# EAGLE design EPGcontrolBipDAC (EAGLE 7.7.0)
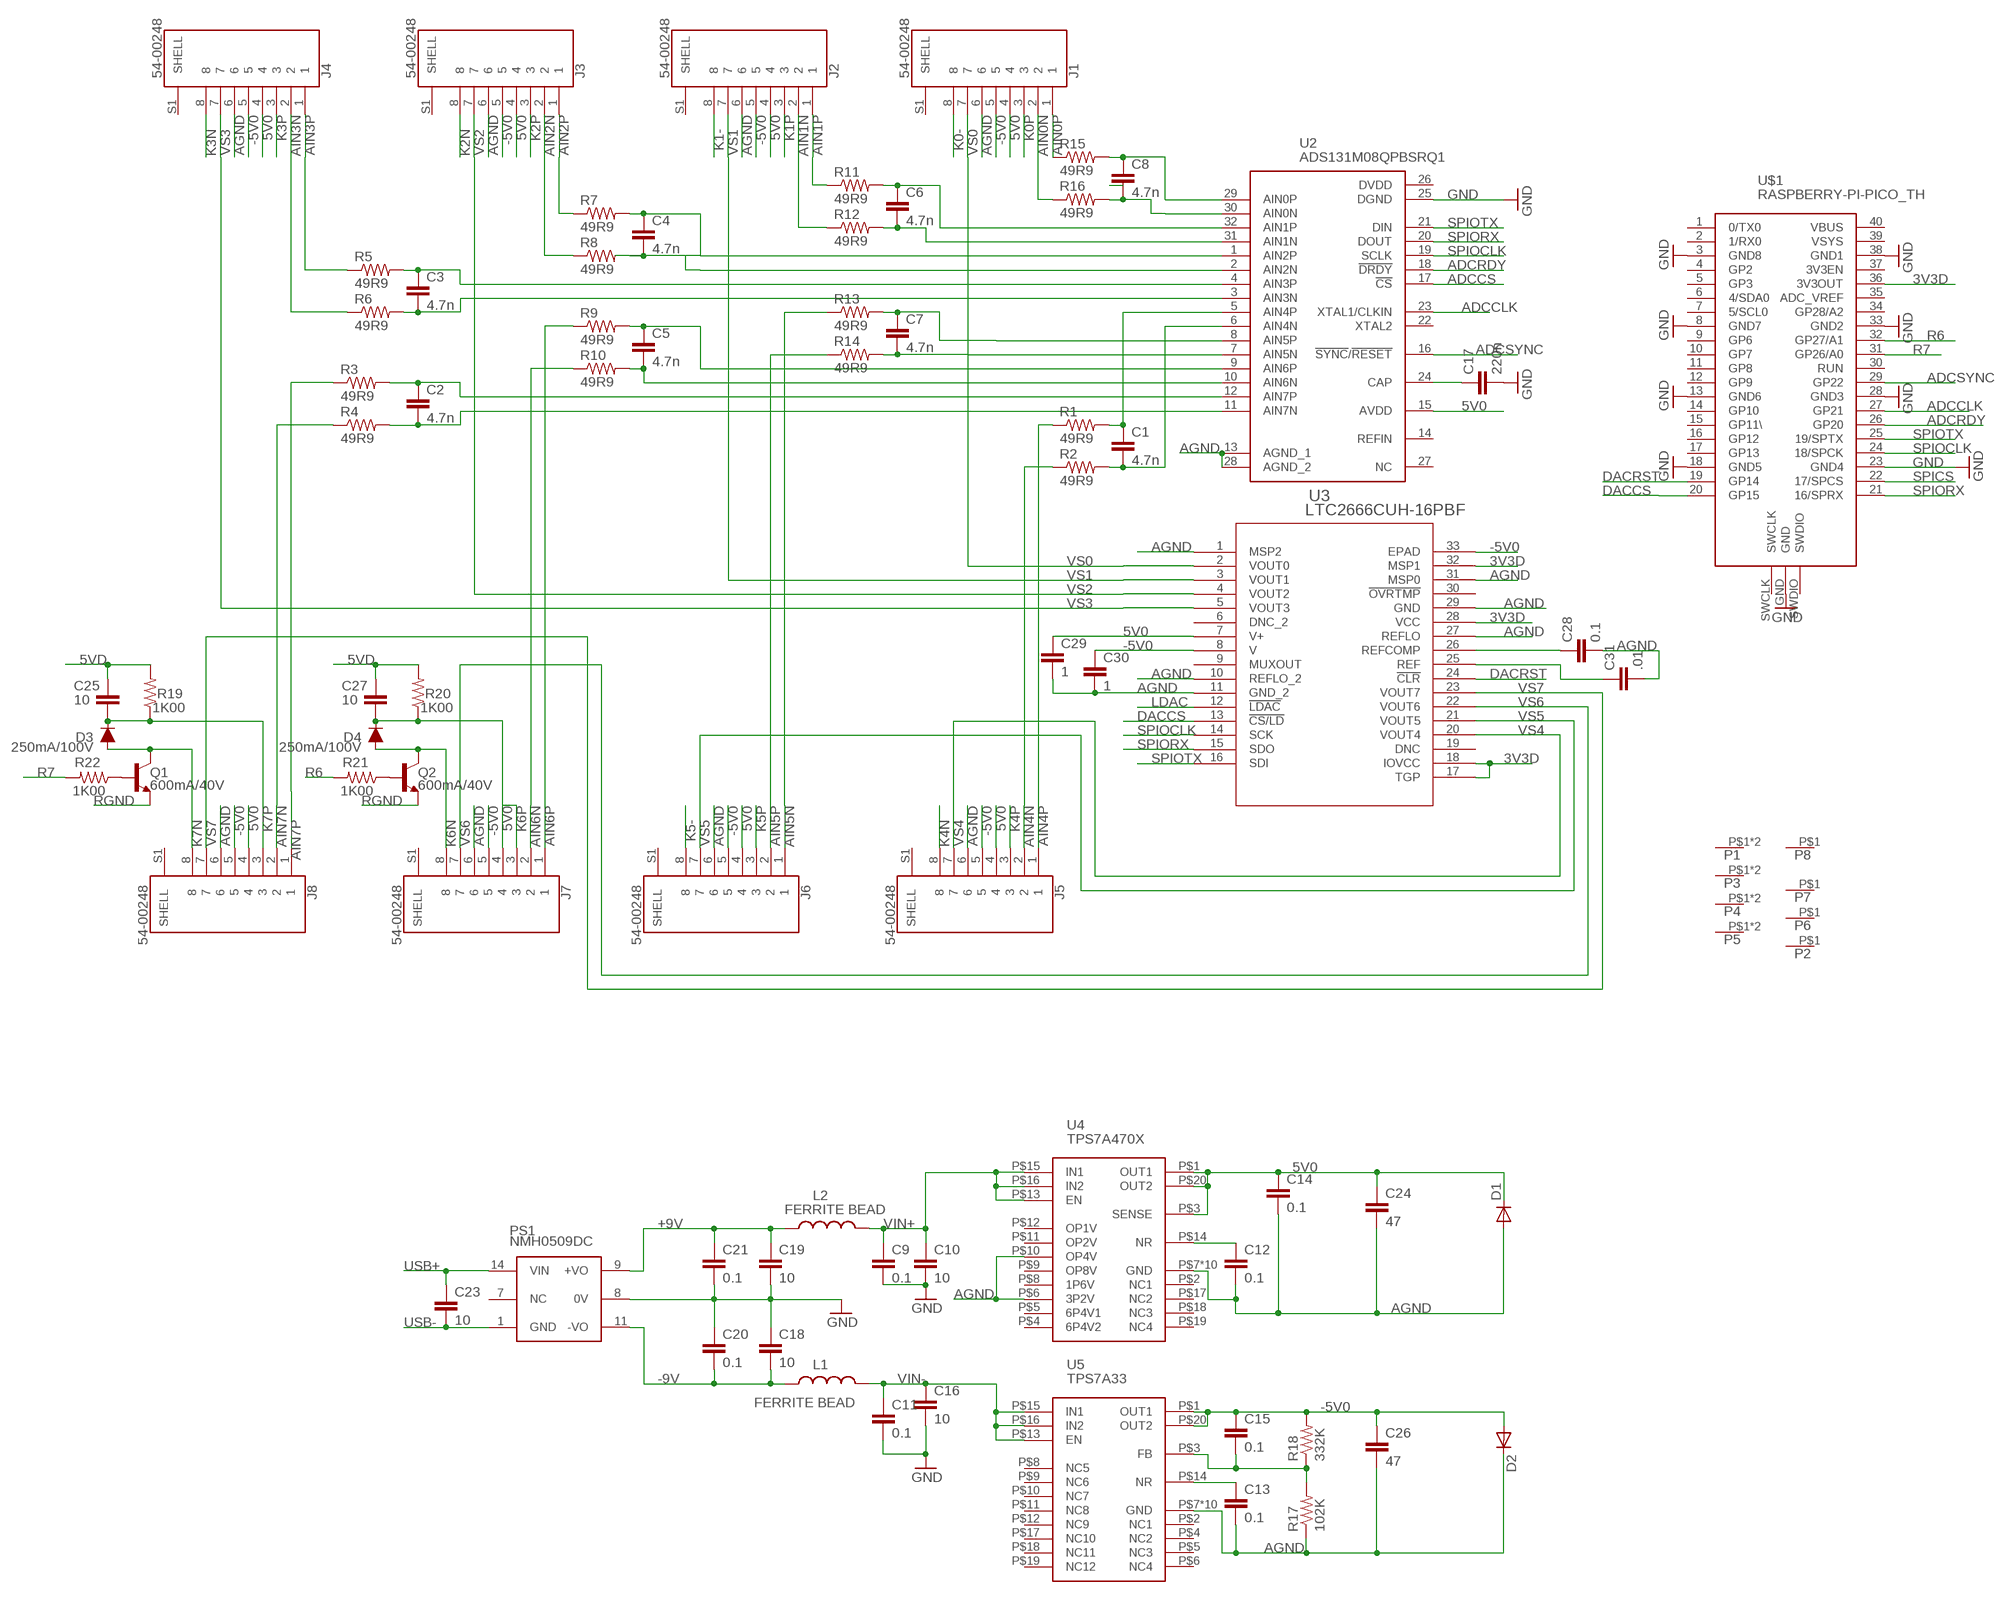
[diagram p0: schematic, sheet 1]

## Parts
C1  4.7n  CAPS0603S  [0603S]
C2  4.7n  CAPS0603S  [0603S]
C3  4.7n  CAPS0603S  [0603S]
C4  4.7n  CAPS0603S  [0603S]
C5  4.7n  CAPS0603S  [0603S]
C6  4.7n  CAPS0603S  [0603S]
C7  4.7n  CAPS0603S  [0603S]
C8  4.7n  CAPS0603S  [0603S]
C9  0.1  CAPS0603S  [0603S]
C10  10  C-EUC1206  [C1206]
C11  0.1  CAPS0603S  [0603S]
C12  0.1  CAPS0603S  [0603S]
C13  0.1  CAPS0603S  [0603S]
C14  0.1  CAPS0603S  [0603S]
C15  0.1  CAPS0603S  [0603S]
C16  10  C-EUC1206  [C1206]
C17  220n  CAPS0603S  [0603S]
C18  10  C-EUC1206  [C1206]
C19  10  C-EUC1206  [C1206]
C20  0.1  CAPS0603S  [0603S]
C21  0.1  CAPS0603S  [0603S]
C23  10  C-EUC1206  [C1206]
C24  47  C-EUC1206  [C1206]
C25  10  CAPS1206S  [1206S]
C26  47  C-EUC1206  [C1206]
C27  10  CAPS1206S  [1206S]
C28  0.1  CAPS0603S  [0603S]
C29  1  CAPS0805S  [0805S]
C30  1  CAPS0805S  [0805S]
C31  .01  CAPS0805S  [0805S]
D1  DIODESMA  [SMA-DIODE]
D2  DIODESMA  [SMA-DIODE]
D3  250mA/100V  DIODE-BAS16J  [SOD-323]
D4  250mA/100V  DIODE-BAS16J  [SOD-323]
J1  54-00248  [TENSILITY_54-00248]
J2  54-00248  [TENSILITY_54-00248]
J3  54-00248  [TENSILITY_54-00248]
J4  54-00248  [TENSILITY_54-00248]
J5  54-00248  [TENSILITY_54-00248]
J6  54-00248  [TENSILITY_54-00248]
J7  54-00248  [TENSILITY_54-00248]
J8  54-00248  [TENSILITY_54-00248]
L1  FERRITE BEAD  INDUCTOR_SM0805S  [0805S]
L2  FERRITE BEAD  INDUCTOR_SM0805S  [0805S]
P1  CON1BANANA  [BANANA_105-0754-001]
P2  CON1574  [574]
P3  CON1BANANA  [BANANA_105-0754-001]
P4  CON1BANANA  [BANANA_105-0754-001]
P5  CON1BANANA  [BANANA_105-0754-001]
P6  CON1574  [574]
P7  CON1574  [574]
P8  CON1574  [574]
PS1  NMH0509DC  DC-DC-PDS1-DUALPDM2  [PDM2]
Q1  600mA/40V  TRANS_NPN-MMBT2222AL  [SOT23-3]
Q2  600mA/40V  TRANS_NPN-MMBT2222AL  [SOT23-3]
R1  49R9  RESISTOR_SM0805S  [0805S]
R2  49R9  RESISTOR_SM0805S  [0805S]
R3  49R9  RESISTOR_SM0805S  [0805S]
R4  49R9  RESISTOR_SM0805S  [0805S]
R5  49R9  RESISTOR_SM0805S  [0805S]
R6  49R9  RESISTOR_SM0805S  [0805S]
R7  49R9  RESISTOR_SM0805S  [0805S]
R8  49R9  RESISTOR_SM0805S  [0805S]
R9  49R9  RESISTOR_SM0805S  [0805S]
R10  49R9  RESISTOR_SM0805S  [0805S]
R11  49R9  RESISTOR_SM0805S  [0805S]
R12  49R9  RESISTOR_SM0805S  [0805S]
R13  49R9  RESISTOR_SM0805S  [0805S]
R14  49R9  RESISTOR_SM0805S  [0805S]
R15  49R9  RESISTOR_SM0805S  [0805S]
R16  49R9  RESISTOR_SM0805S  [0805S]
R17  102K  R-US_R0805  [R0805]
R18  332K  R-US_R0805  [R0805]
R19  1K00  RESISTOR_SM0805S  [0805S]
R20  1K00  RESISTOR_SM0805S  [0805S]
R21  1K00  RESISTOR_SM0805S  [0805S]
R22  1K00  RESISTOR_SM0805S  [0805S]
U2  ADS131M08QPBSRQ1  [QFP50P700X700X120-32N]
U3  LTC2666CUH-16PBF  [UH_32_ADI]
U4  TPS7A470X  [VQFN-20-5X5]
U5  TPS7A33  [VQFN-20-5X5]
U$1  RASPBERRY-PI-PICO_TH  [FT_RASPBERRY-PI-PICO_TH]

## Nets
3V3D: U3.17(TGP) U3.18(IOVCC) U3.28(VCC) U3.32(MSP1) U$1.36(3V3OUT)
5V0: C14.1 C24.1 C29.1 D1.C J1.4 J2.4 J3.4 J4.4 J5.4 J6.4 J7.4 J8.4 U2.15(AVDD) U3.7(V+) U4.P$1(OUT1) U4.P$3(SENSE) U4.P$20(OUT2)
5VD: C25.1 C27.1 R19.2 R20.2
+9V: C19.1 C21.1 L2.1 PS1.9(+VO)
-5V0: C15.1 C26.1 C30.1 D2.A J1.5 J2.5 J3.5 J4.5 J5.5 J6.5 J7.5 J8.5 R18.2 U3.8(V) U3.33(EPAD) U5.P$1(OUT1) U5.P$20(OUT2)
-9V: C18.2 C20.2 L1.1 PS1.11(-VO)
A0N: C8.2 R16.2 U2.30(AIN0N)
A0P: C8.1 R15.2 U2.29(AIN0P)
A1N: C6.2 R12.2 U2.31(AIN1N)
A1P: C6.1 R11.2 U2.32(AIN1P)
A2N: C4.2 R8.2 U2.2(AIN2N)
A2P: C4.1 R7.2 U2.1(AIN2P)
A3N: C3.2 R6.2 U2.3(AIN3N)
A3P: C3.1 R5.2 U2.4(AIN3P)
A4N: C1.2 R2.2 U2.6(AIN4N)
A4P: C1.1 R1.2 U2.5(AIN4P)
A5N: C7.2 R14.2 U2.7(AIN5N)
A5P: C7.1 R13.2 U2.8(AIN5P)
A6N: C5.2 R10.2 U2.10(AIN6N)
A6P: C5.1 R9.2 U2.9(AIN6P)
A7N: C2.2 R4.2 U2.11(AIN7N)
A7P: C2.1 R3.2 U2.12(AIN7P)
ADCCLK: U2.23(XTAL1/CLKIN) U$1.27(GP21)
ADCCS: U2.17(!CS)
ADCRDY: U2.18(!DRDY) U$1.26(GP20)
ADCSYNC: U2.16(!SYNC!/!RESET) U$1.29(GP22)
AGND: C12.2 C13.2 C14.2 C24.2 C26.2 C28.2 C29.2 C30.2 C31.2 D1.A D2.C J1.6 J2.6 J3.6 J4.6 J5.6 J6.6 J7.6 J8.6 R17.1 U2.13(AGND_1) U2.28(AGND_2) U3.1(MSP2) U3.10(REFLO_2) U3.11(GND_2) U3.27(REFLO) U3.29(GND) U3.31(MSP0) U4.P$6(3P2V) U4.P$7(GND) U4.P$10(OP4V) U4.PAD1(GND) U4.PAD2(GND) U4.PAD3(GND) U4.PAD4(GND) U4.PAD5(GND) U4.PAD6(GND) U4.PAD7(GND) U4.PAD8(GND) U4.PAD9(GND) U5.P$7(GND) U5.PAD1(GND) U5.PAD2(GND) U5.PAD3(GND) U5.PAD4(GND) U5.PAD5(GND) U5.PAD6(GND) U5.PAD7(GND) U5.PAD8(GND) U5.PAD9(GND)
AIN0N: J1.2 R16.1
AIN0P: J1.1 R15.1
AIN1N: J2.2 R12.1
AIN1P: J2.1 R11.1
AIN2N: J3.2 R8.1
AIN2P: J3.1 R7.1
AIN3N: J4.2 R6.1
AIN3P: J4.1 R5.1
AIN4N: J5.2 R2.1
AIN4P: J5.1 R1.1
AIN5N: J6.1 R13.1
AIN5P: J6.2 R14.1
AIN6N: J7.2 R10.1
AIN6P: J7.1 R9.1
AIN7N: J8.2 R4.1
AIN7P: J8.1 R3.1
DACCS: U3.13(!CS/LD) U$1.20(GP15)
DACRST: U3.24(!CLR) U$1.19(GP14)
GND: C9.2 C10.2 C11.2 C16.2 C17.2 C18.1 C19.2 C20.1 C21.2 PS1.8(0V) U2.25(DGND) U$1.3(GND8) U$1.8(GND7) U$1.13(GND6) U$1.18(GND5) U$1.23(GND4) U$1.28(GND3) U$1.33(GND2) U$1.38(GND1) U$1.GND
K0-: J1.8
K0P: J1.3
K1-: J2.8
K1P: J2.3
K2N: J3.8
K2P: J3.3
K3N: J4.8
K3P: J4.3
K4N: J5.8
K4P: J5.3
K5-: J6.8
K5P: J6.3
K6N: D4.A J7.8 Q2.3(C)
K6P: C27.2 D4.C J7.3 R20.1
K7N: D3.A J8.8 Q1.3(C)
K7P: C25.2 D3.C J8.3 R19.1
LDAC: U3.12(!LDAC)
N$1: C15.2 R17.2 R18.1 U5.P$3(FB)
N$2: C17.1 U2.24(CAP)
N$3: Q2.1(B) R21.1
N$4: Q1.1(B) R22.1
N$8: C28.1 U3.26(REFCOMP)
N$11: C31.1 U3.25(REF)
N$18: C13.1 U5.P$14(NR)
N$23: C12.1 U4.P$14(NR)
R6: R21.2 U$1.32(GP27/A1)
R7: R22.2 U$1.31(GP26/A0)
RGND: Q1.2(E) Q2.2(E)
SPICS: U$1.22(17/SPCS)
SPIOCLK: U2.19(SCLK) U3.14(SCK) U$1.24(18/SPCK)
SPIORX: U2.20(DOUT) U3.15(SDO) U$1.21(16/SPRX)
SPIOTX: U2.21(DIN) U3.16(SDI) U$1.25(19/SPTX)
USB+: C23.1 PS1.14(VIN)
USB-: C23.2 PS1.1(GND)
VIN+: C9.1 C10.1 L2.2 U4.P$13(EN) U4.P$15(IN1) U4.P$16(IN2)
VIN-: C11.1 C16.1 L1.2 U5.P$13(EN) U5.P$15(IN1) U5.P$16(IN2)
VS0: J1.7 U3.2(VOUT0)
VS1: J2.7 U3.3(VOUT1)
VS2: J3.7 U3.4(VOUT2)
VS3: J4.7 U3.5(VOUT3)
VS4: J5.7 U3.20(VOUT4)
VS5: J6.7 U3.21(VOUT5)
VS6: J7.7 U3.22(VOUT6)
VS7: J8.7 U3.23(VOUT7)
Unconnected: J1.S1(SHELL) J2.S1(SHELL) J3.S1(SHELL) J4.S1(SHELL) J5.S1(SHELL) J6.S1(SHELL) J7.S1(SHELL) J8.S1(SHELL) P1.P$1 P1.P$2 P2.P$1 P3.P$1 P3.P$2 P4.P$1 P4.P$2 P5.P$1 P5.P$2 P6.P$1 P7.P$1 P8.P$1 PS1.7(NC) U2.14(REFIN) U2.22(XTAL2) U2.26(DVDD) U2.27(NC) U3.6(DNC_2) U3.9(MUXOUT) U3.19(DNC) U3.30(!OVRTMP) U4.P$2(NC1) U4.P$4(6P4V2) U4.P$5(6P4V1) U4.P$8(1P6V) U4.P$9(OP8V) U4.P$11(OP2V) U4.P$12(OP1V) U4.P$17(NC2) U4.P$18(NC3) U4.P$19(NC4) U5.P$2(NC1) U5.P$4(NC2) U5.P$5(NC3) U5.P$6(NC4) U5.P$8(NC5) U5.P$9(NC6) U5.P$10(NC7) U5.P$11(NC8) U5.P$12(NC9) U5.P$17(NC10) U5.P$18(NC11) U5.P$19(NC12) U$1.1(0/TX0) U$1.2(1/RX0) U$1.4(GP2) U$1.5(GP3) U$1.6(4/SDA0) U$1.7(5/SCL0) U$1.9(GP6) U$1.10(GP7) U$1.11(GP8) U$1.12(GP9) U$1.14(GP10) U$1.15(GP11\) U$1.16(GP12) U$1.17(GP13) U$1.30(RUN) U$1.34(GP28/A2) U$1.35(ADC_VREF) U$1.37(3V3EN) U$1.39(VSYS) U$1.40(VBUS) U$1.SWCLK U$1.SWDIO

## Library data of the parts
C1-C9 C11-C15 C17 C20 C21 C25 C27-C31 = STEVES_BU:CAPS
C10 C16 C18 C19 C23 C24 C26 = rcl:C-EU: CAPACITOR, European symbol
D1 D2 = SparkFun:DIODE: Diode
D3 D4 = SparkFun-DiscreteSemi:DIODE: Diode; PROD_ID: DIO-09646
J1-J8 = 54-00248:54-00248
L1 L2 = STEVES_BU:INDUCTOR_SM
P1-P8 = STEVES_BU:CON1
PS1 = STEVES_BU:DC-DC-PDS1-DUAL
Q1 Q2 = SparkFun-DiscreteSemi:TRANS_NPN: NPN transistor Current controlled devices typically used to amplify current or used as a switch. BC547 - COM-08928 <http://www.sparkfun.com/products/8928> (TO-92 45V 100mA) (1.Collector 2.Base 3.Emitter) 2N3904 - COM-00521 <http://www.sparkfun.com/products/521> (TO-92 40V 200mA) (1.Emitter 2.Base 3.Collector) P2N2222A - COM-12852 <http://www.sparkfun.com/products/12852> (TO-92 40V 600mA) (1.Collector 2.Base 3.Emitter); PROD_ID: TRANS-08049
R1-R16 R19-R22 = STEVES_BU:RESISTOR_SM
R17 R18 = rcl:R-US_: RESISTOR, American symbol
U2 = SamacSys_Parts:ADS131M08QPBSRQ1: Analog to Digital Converters - ADC Automotive, eight-channel, 24-bit, 32-kSPS, simultaneous-sampling, delta-sigma ADC Source: Datasheet <https://www.ti.com/lit/ds/symlink/ads131m08-q1.pdf?HQS=dis-mous-null-mousermode-dsf-pf-null-wwe&ts=1673864581738&ref_url=https%3A%2F%2Fwww.ti.com%2Fgeneral%2Fdocs%2Fsuppproductinfo.tsp%3FdistId%3D26%26gotoUrl%3Dhttps%3A%2F%2Fwww.>; ARROW_PART_NUMBER: ADS131M08QPBSRQ1; ARROW_PRICE-STOCK: https://www.arrow.com/en/products/ads131m08qpbsrq1/texas-instruments.html?utm_currency=USD&region=nac; DESCRIPTION: Analog to Digital Converters - ADC Automotive, eight-channel, 24-bit, 32-kSPS, simultaneous-sampling, delta-sigma ADC; HEIGHT: 1.2mm; MANUFACTURER_NAME: Texas Instruments; MANUFACTURER_PART_NUMBER: ADS131M08QPBSRQ1; MOUSER_PART_NUMBER: 595-ADS131M08QPBSRQ1; MOUSER_PRICE-STOCK: https://www.mouser.co.uk/ProductDetail/Texas-Instruments/ADS131M08QPBSRQ1?qs=By6Nw2ByBD1kYCTLuI53zA%3D%3D
U3 = STEVES_BU:LTC2666CUH-16PBF; COPYRIGHT: Copyright (C) 2026 Ultra Librarian. All rights reserved.; DATASHEET: https://www.analog.com/media/en/technical-documentation/data-sheets/ltc2666.pdf; DESCRIPTION: Octal 16-Bit/12-Bit ±10V VOUT SoftSpan DACs with 10ppm/°C Max Reference; MANUFACTURER_NAME: Analog Devices Inc; MANUFACTURER_PART_NUMBER: LTC2666CUH-16#PBF
U4 = STEVES_BU:TPS7A470X
U5 = STEVES_BU:TPS7A33: TPS7A33 –36-V, 1-A, Ultralow-Noise Negative Voltage Regulator
U$1 = pipico:RASPBERRY-PI-PICO_TH: Raspberry Pi Pico microcontroller board for through-hole mounting.

## Board
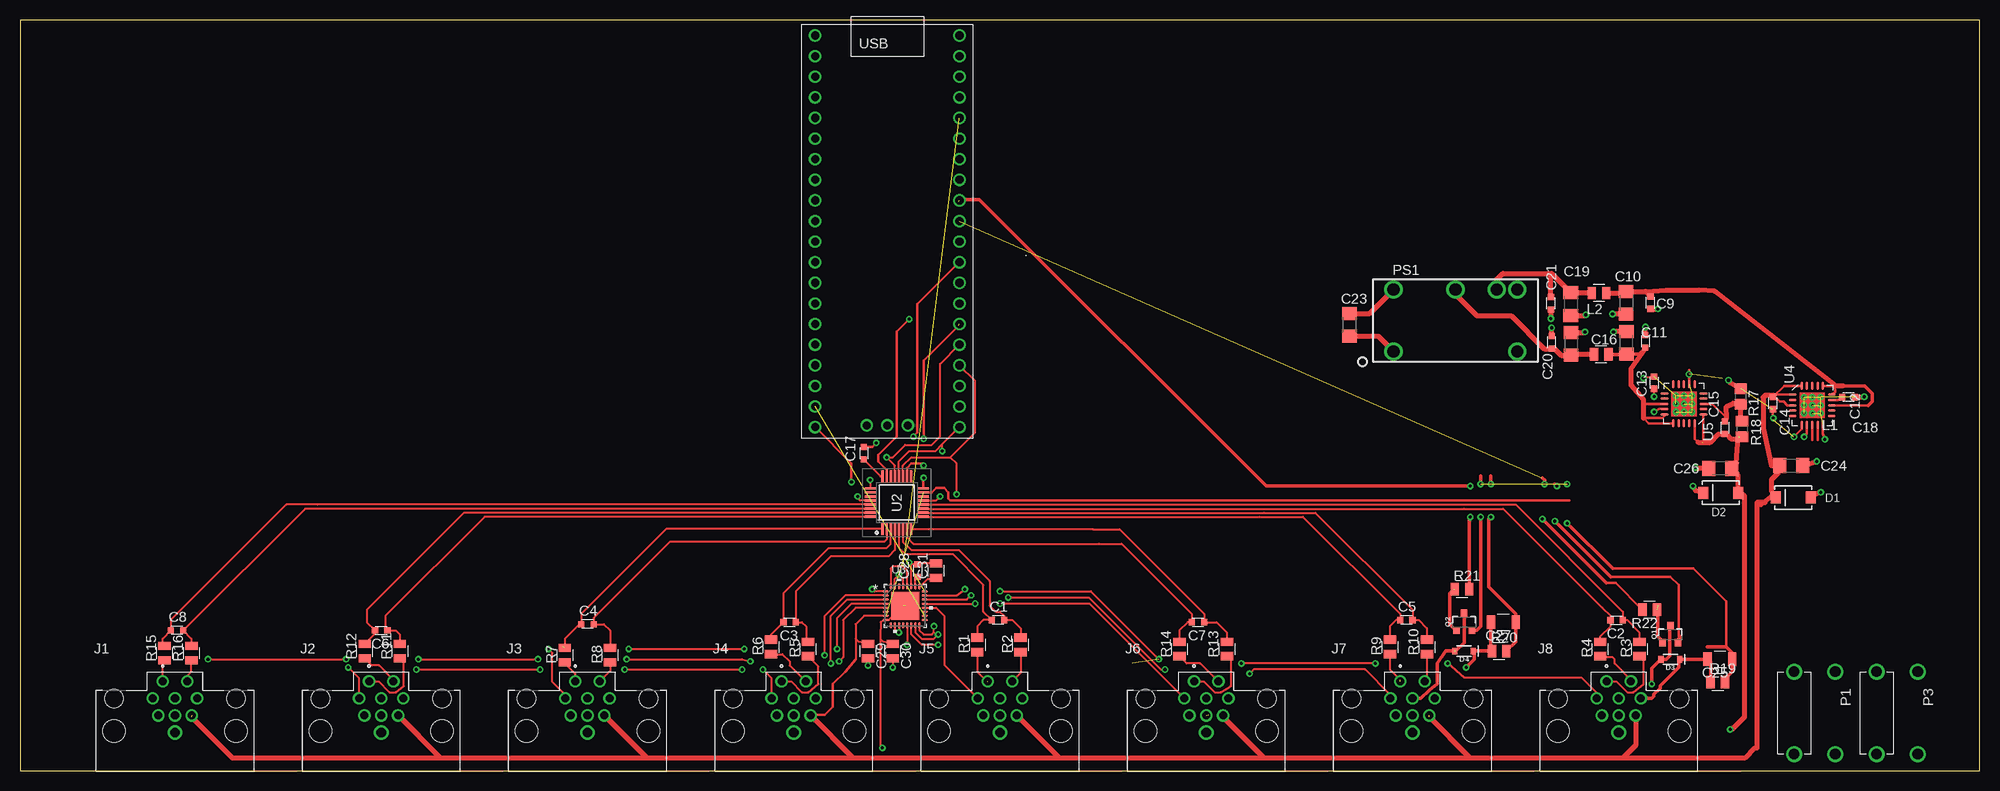
[diagram p1: board, top side]
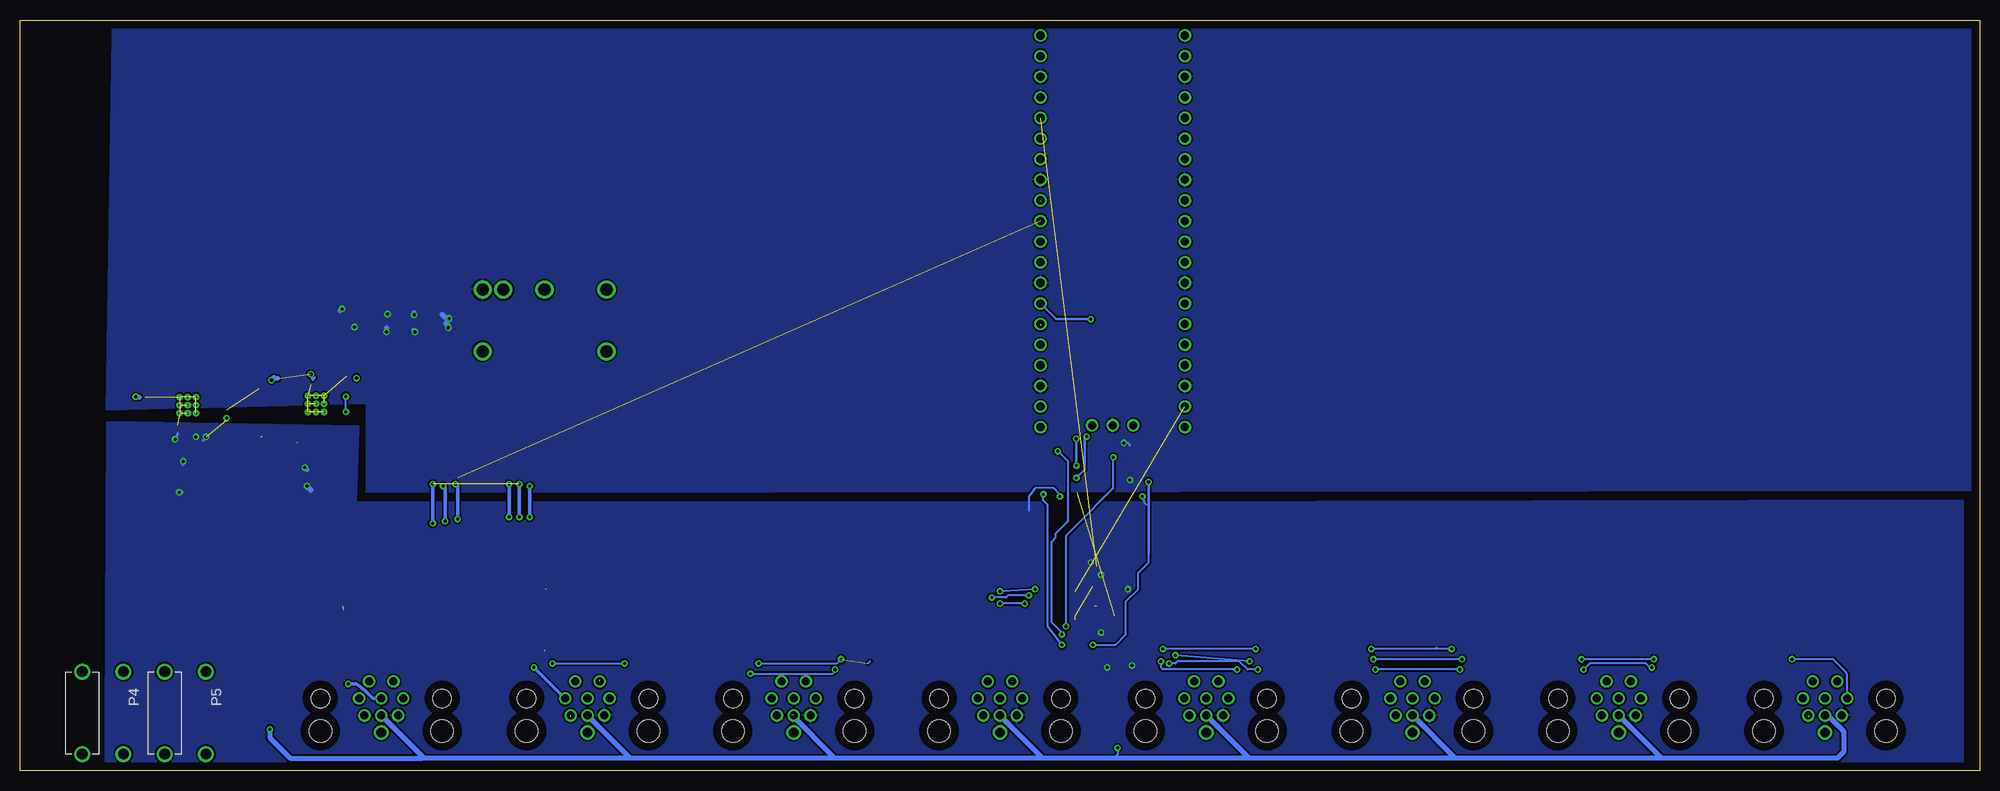
[diagram p2: board, bottom side, seen from below]

Size 241.3 x 92.46 mm. Coordinates in mm from the lower left corner, seen from the top.
Outline: 0,0 241.3,0 241.3,92.46 0,92.46 0,0
Copper layers (1*16): Top 0.035mm / dielectric 1.5mm / Bottom 0.035mm
Design rules "default": minimum track width 10mil, minimum drill 24mil, track to track 8mil, track to pad 8mil, pad to pad 8mil, via to via 8mil, smd to smd 8mil, copper to edge 40mil, drill to drill 8mil, minimum pad ring 10mil, minimum via ring 8mil, stop-mask expansion 4mil, vias tented up to drill 0mil, thermal gap 10mil

### Footprints (pad centres in the part's own frame; a part is rotated, then mirrored left to right if it is on the bottom)
0603S = smd 0.762 x 0.762: 1 -0.762,0; 2 0.762,0
C1206 = smd 1.6 x 1.8: 1 -1.4,0; 2 1.4,0
1206S = smd 1.016 x 1.651: 1 -1.524,0; 2 1.524,0
0805S = smd 1.016 x 1.524: 1 -0.889,0; 2 0.889,0
SMA-DIODE = smd 1.27 x 1.47: A -2.15,0; C 2.15,0
SOD-323 = smd 0.63 x 0.83: A 1.15,0; C -1.15,0
TENSILITY_54-00248 = drill 1 pad 1.4: 1 -1.5,2.1; 2 1.5,2.1; 3 2.725,0; 4 2.075,-2.1; 5 0,-2.1; 6 -2.075,-2.1; 7 -2.725,0; 8 0,0 | drill 1.2 pad 1.7: S1 0,-4.191 | hole 2.3: -7.5,0; 7.5,0 | hole 2.8: -7.5,-4; 7.5,-4
BANANA_105-0754-001 = drill 1.321: P$1 0,0; P$2 -10.16,0
574 = drill 5.41: P$1 0,0
PDM2 = drill 1.5: 1 -7.62,-3.81; 7 7.62,-3.81; 8 7.62,3.81; 9 5.08,3.81; 11 0,3.81; 14 -7.62,3.81
SOT23-3 = smd 0.8 x 0.9: 1 -0.95,-1; 2 0.95,-1; 3 0,1.1
R0805 = smd 1.3 x 1.5: 1 -0.95,0; 2 0.95,0
QFP50P700X700X120-32N = smd 1.45 x 0.3: 1 -3.225,1.75; 2 -3.225,1.25; 3 -3.225,0.75; 4 -3.225,0.25; 5 -3.225,-0.25; 6 -3.225,-0.75; 7 -3.225,-1.25; 8 -3.225,-1.75; 17 3.225,-1.75; 18 3.225,-1.25; 19 3.225,-0.75; 20 3.225,-0.25; 21 3.225,0.25; 22 3.225,0.75; 23 3.225,1.25; 24 3.225,1.75 | smd 0.3 x 1.45: 9 -1.75,-3.225; 10 -1.25,-3.225; 11 -0.75,-3.225; 12 -0.25,-3.225; 13 0.25,-3.225; 14 0.75,-3.225; 15 1.25,-3.225; 16 1.75,-3.225; 25 1.75,3.225; 26 1.25,3.225; 27 0.75,3.225; 28 0.25,3.225; 29 -0.25,3.225; 30 -0.75,3.225; 31 -1.25,3.225; 32 -1.75,3.225
UH_32_ADI = smd 0.813 x 0.254: 1 -2.4,1.75; 2 -2.4,1.25; 3 -2.4,0.75; 4 -2.4,0.25; 5 -2.4,-0.25; 6 -2.4,-0.75; 7 -2.4,-1.25; 8 -2.4,-1.75; 17 2.4,-1.75; 18 2.4,-1.25; 19 2.4,-0.75; 20 2.4,-0.25; 21 2.4,0.25; 22 2.4,0.75; 23 2.4,1.25; 24 2.4,1.75 | smd 0.254 x 0.813: 9 -1.75,-2.4; 10 -1.25,-2.4; 11 -0.75,-2.4; 12 -0.25,-2.4; 13 0.25,-2.4; 14 0.75,-2.4; 15 1.25,-2.4; 16 1.75,-2.4; 25 1.75,2.4; 26 1.25,2.4; 27 0.75,2.4; 28 0.25,2.4; 29 -0.25,2.4; 30 -0.75,2.4; 31 -1.25,2.4; 32 -1.75,2.4 | smd 3.454 x 3.454: 33 0,0
VQFN-20-5X5 = smd 0.95 x 0.3: P$1 -2.4,1.3; P$2 -2.4,0.65; P$3 -2.4,0; P$4 -2.4,-0.65; P$5 -2.4,-1.3; P$11 2.4,-1.3; P$12 2.4,-0.65; P$13 2.4,0; P$14 2.4,0.65; P$15 2.4,1.3 | smd 0.3 x 0.95: P$6 -1.3,-2.4; P$7 -0.65,-2.4; P$8 0,-2.4; P$9 0.65,-2.4; P$10 1.3,-2.4; P$16 1.3,2.4; P$17 0.65,2.4; P$18 0,2.4; P$19 -0.65,2.4; P$20 -1.3,2.4 | drill 0.305: PAD1 -1,1; PAD2 0,1; PAD3 1,1; PAD4 -1,0; PAD5 0,0; PAD6 1,0; PAD7 -1,-1; PAD8 0,-1; PAD9 1,-1
FT_RASPBERRY-PI-PICO_TH = drill 1: 1 -8.55,24.03; 2 -8.55,21.49; 3 -8.55,18.95; 4 -8.55,16.41; 5 -8.55,13.87; 6 -8.55,11.33; 7 -8.55,8.79; 8 -8.55,6.25; 9 -8.55,3.71; 10 -8.55,1.17; 11 -8.55,-1.37; 12 -8.55,-3.91; 13 -8.55,-6.45; 14 -8.55,-8.99; 15 -8.55,-11.53; 16 -8.55,-14.07; 17 -8.55,-16.61; 18 -8.55,-19.15; 19 -8.55,-21.69; 20 -8.55,-24.23; 21 9.23,-24.23; 22 9.23,-21.69; 23 9.23,-19.15; 24 9.23,-16.61; 25 9.23,-14.07; 26 9.23,-11.53; 27 9.23,-8.99; 28 9.23,-6.45; 29 9.23,-3.91; 30 9.23,-1.37; 31 9.23,1.17; 32 9.23,3.71; 33 9.23,6.25; 34 9.23,8.79; 35 9.23,11.33; 36 9.23,13.87; 37 9.23,16.41; 38 9.23,18.95; 39 9.23,21.49; 40 9.23,24.03; GND 0.34,-24; SWCLK -2.2,-24; SWDIO 2.88,-24

### Placement (x,y rotation side)
C1  120.4,18.54 0 top
C2  196.6,18.54 180 top
C3  94.74,18.29 180 top
C4  69.85,18.03 0 top
C5  170.69,18.54 0 top
C6  44.45,17.27 180 top
C7  145.03,18.29 180 top
C8  19.3,17.27 0 top
C9  200.76,57.66 270 top
C10  197.76,57.63 270 top
C11  200.12,52.89 90 top
C12  225.15,46 0 top
C13  201.19,47.81 90 top
C14  215.84,45.28 270 top
C15  209.91,42.26 90 top
C16  197.8,52.7 90 top
C17  103.89,39.12 90 top
C18  190.97,52.6 270 top
C19  190.94,57.5 270 top
C20  188.59,52.78 270 top
C21  188.5,57.58 270 top
C23  163.67,54.92 270 top
C24  218.1,37.6 0 top
C25  209.3,13.72 180 top
C26  209.35,37.23 180 top
C27  182.63,18.29 180 top
C28  110.49,24.64 90 top
C29  104.39,14.73 270 top
C30  107.44,14.73 270 top
C31  112.78,24.64 90 top
D1  218.34,33.63 180 top
D2  209.4,34.23 180 top
D3  203.2,13.72 180 top
D4  177.8,14.73 180 top
J1  19.05,8.89 0 top
J2  44.45,8.89 0 top
J3  69.85,8.89 0 top
J4  95.25,8.89 0 top
J5  120.65,8.89 0 top
J6  146.05,8.89 0 top
J7  171.45,8.89 0 top
J8  196.85,8.89 0 top
L1  194.69,51.3 0 top
L2  194.41,58.85 0 top
P1  218.44,2.03 270 top
P2  218.69,-22.86 0 top  (outside the outline)
P3  228.6,2.03 270 top
P4  233.68,2.03 270 bottom
P5  223.52,2.03 270 bottom
P6  234.19,-22.86 0 top  (outside the outline)
P7  218.69,-39.88 0 top  (outside the outline)
P8  234.7,-40.89 0 top  (outside the outline)
PS1  176.74,55.46 0 top
Q1  203.2,16.76 0 top
Q2  177.8,18.29 0 top
R1  117.86,15.49 90 top
R2  123.19,15.49 90 top
R3  199.39,14.99 90 top
R4  194.56,14.99 90 top
R5  97.03,14.99 90 top
R6  92.46,15.24 90 top
R7  67.06,14.22 90 top
R8  72.64,14.22 90 top
R9  168.66,15.24 90 top
R10  173.23,15.24 90 top
R11  46.74,14.73 90 top
R12  42.42,14.73 90 top
R13  148.59,14.99 90 top
R14  142.75,14.99 90 top
R15  17.78,14.48 90 top
R16  21.08,14.48 90 top
R17  211.86,46.1 270 top
R18  212.02,42.1 270 top
R19  209.04,10.92 0 top
R20  182.12,14.73 0 top
R21  177.55,22.35 0 top
R22  200.66,19.81 180 top
U2  107.95,33.02 90 top
U3  108.97,20.32 0 top
U4  220.68,45.02 0 top
U5  204.88,45.19 180 top
U$1  106.43,66.55 0 top

### Tracks (layer width: path | path; a pad name or v marks a point on that pad's centre or on a via)
3V3D  (3 unrouted)
  Top 0.254: U3.28 109.22,24.64 108.71,25.15 107.44,25.15 107.19,24.89 107.19,22.75 U3.32
5V0  (3 unrouted)
  Top 0.254: U3.7 103.91,19.07 102.87,18.03 102.87,16.26 | 102.87,16.26 102.87,13.72 | C29.1 103.25,15.88 102.87,16.26
  Top 0.305: U4.P$1 216.12,46.32 C14.1 | U4.P$20 217.22,47.42 C14.1 | U4.P$3 217.62,45.02 217.17,45.47 216.66,45.47 215.9,46.23 215.9,46.1 C14.1 | U2.15 112.25,34.27 112.78,34.8 113.79,34.8 114.3,34.29 114.3,33.53 114.55,33.27 190.75,33.27 | 214.88,33.02 215.65,33.78 | 102.87,13.72 101.6,12.19 100.08,10.67 100.08,7.87 99.06,6.86 97.39,6.86 J4.4
  Top 0.61: J8.4 198.93,3.09 197.36,1.52 | 197.36,1.52 178.56,1.52 | 178.56,1.52 173.48,6.6 | 178.56,1.52 153.16,1.52 | 153.16,1.52 148.08,6.6 148.08,6.75 J6.4 | 153.16,1.52 127.99,1.52 | 127.99,1.52 J5.4 | 127.99,1.52 102.59,1.52 | 102.59,1.52 J4.4 | 102.59,1.52 77.19,1.52 | 77.19,1.52 J3.4 | 77.19,1.52 51.79,1.52 | 51.79,1.52 J2.4 | 51.79,1.52 26.16,1.52 21.08,6.6 | 216.11,33.75 215.65,34.44 215.65,35.81 216.44,36.61 C24.1 216.69,37.59 215.65,37.59 214.63,42.16 214.63,45.97 214.88,46.23 215.9,46.23 | 216.11,33.75 D1.C | 214.38,32.77 215.65,33.78 216.15,33.71 216.11,33.75 | 214.88,33.02 213.87,33.02 213.87,2.79 213.61,2.79 212.34,1.52 197.36,1.52
5VD  (via drill 0.38)  (1 unrouted)
  Top 0.305: 196.09,24.89 205.99,24.89 210.06,20.83 210.06,15.24 210.19,15.11
  Top 0.406: R20.2 184.15,15.88 C27.1 184.15,19.3 180.85,22.61 180.85,30.99 v181.1,31.24 | v181.1,35.31 181.1,36.32 | R19.2 209.93,11.3 210.82,12.19 C25.1 210.82,14.48 210.19,15.11 210.06,15.24 207.77,15.24 | 196.09,24.89 v190.5,30.48 | v190.5,35.31 190.5,35.05
  Bottom 0.406: v181.1,31.24 v181.1,35.31 | v190.5,30.48 v190.5,35.31
+9V
  Top 0.61: PS1.9 181.82,60.48 182.59,61.25 188.19,61.25 | 188.19,61.25 188.58,61.25 C19.1 190.98,58.85 L2.1 | C21.1 188.5,60.95 188.19,61.25
-5V0  (via drill 0.38)  (5 unrouted)
  Top 0.254: 105.92,16.26 105.92,16.51 105.95,18.32 U3.8 106.96,18.57 107.7,19.3 108.71,20.32 | 105.92,16.26 105.92,10.67 105.92,10.41 105.92,3.05 v106.17,2.79 | C30.1 106.3,15.88 105.92,16.26
  Top 0.28: U5.P$1 207.28,40.37 | U5.P$20 206.18,41.17 | 211.66,41.06 R18.2
  Top 0.305: 210.59,5.1 v210.57,5.08 | 206.18,41.17 206.18,40.88 206.61,40.45
  Top 0.61: 206.61,40.45 207.14,40.42 | R18.2 211.76,40.89 210.66,40.89 210.06,41.5 C15.1 209.8,41.4 209.04,41.4 208.03,40.39 207.26,40.39 | 211.58,34.21 D2.A | D2.A 211.55,36.43 C26.1 210.75,37.27 211.33,37.85 211.58,41.15 | 210.59,5.1 210.84,5.1 212.34,6.6 212.34,33.78 211.84,34.29 211.61,34.29 D2.A
  Bottom 0.254: v106.17,2.79 106.17,2.03 106.43,1.78 106.43,1.52
  Bottom 0.61: J1.5 18.73,6.79 16.76,4.83 16.76,2.29 17.53,1.52 39.18,1.52 | 39.18,1.52 J2.5 | 39.18,1.52 64.58,1.52 | 64.58,1.52 J3.5 | 64.58,1.52 89.98,1.52 | 89.98,1.52 J4.5 | 89.98,1.52 106.43,1.52 115.38,1.52 | 115.38,1.52 J5.5 | 115.38,1.52 140.97,1.52 | 140.97,1.52 146.3,6.86 | 140.97,1.52 166.18,1.52 | 166.18,1.52 J7.5 | 166.18,1.52 191.58,1.52 191.68,1.62 | 191.68,1.62 J8.5 | v210.57,5.08 210.57,4.06 208.03,1.52 191.77,1.52 191.68,1.62
-9V
  Top 0.61: PS1.11 176.74,58.7 179.39,56.05 183.59,56.05 187.69,51.95 188.53,51.95 C20.2 188.93,52.02 189.79,51.15 190.92,51.15 C18.2 191.07,51.3 L1.1
A0N
  Top 0.254: U2.30 37.35,32.27 35.06,32.27 C8.2 21.08,16.26 R16.2 | R16.2 21.08,15.24 R16.2
A0P
  Top 0.254: U2.29 36.58,32.77 32.77,32.77 18.54,18.54 C8.1 17.53,16.26 17.53,15.24 17.65,15.37 R15.2
A1N
  Top 0.254: U2.31 62.25,31.77 54.63,31.77 42.67,19.81 42.67,18.29 C6.2 43.69,16.89 R12.2
A1P
  Top 0.254: U2.32 63.02,31.27 57.18,31.27 44.96,19.05 44.96,17.53 C6.1 46.23,17.27 46.74,16.76 R11.2
A2N
  Top 0.254: U2.2 106.7,28.47 106.43,28.19 85.34,28.19 80.01,28.19 70.61,18.8 C4.2 70.87,18.03 71.88,18.03 72.64,17.27 R8.2
A2P  (1 unrouted)
  Top 0.254: U2.1 85.67,29.8 79.58,29.8 69.09,19.3 C4.1 68.83,18.03 67.06,16.26 67.06,15.49 66.8,15.24
A3N
  Top 0.254: U2.3 107.19,29.78 107.19,27.94 106.68,27.43 99.57,27.43 96.75,24.61 93.98,21.84 C3.2 | C3.2 93.98,18.03 C3.2 | R6.2 92.46,16.76 C3.2
A3P
  Top 0.254: U2.4 107.7,27.18 106.93,26.42 99.82,26.42 97.79,24.38 95.5,22.1 95.5,20.83 C3.1 96.27,18.29 96.77,17.78 96.77,16.13 R5.2
A4N
  Top 0.254: U2.6 108.7,28.21 109.73,27.18 115.57,27.18 119.38,23.37 119.38,20.32 120.14,19.56 120.65,19.56 121.16,19.05 C1.2 122.17,18.54 123.19,17.53 R2.2
A4P
  Top 0.254: U2.5 108.2,27.44 108.97,26.67 114.81,26.67 118.49,22.99 | 118.49,22.99 118.62,22.86 | 118.62,22.86 118.62,19.56 C1.1 118.62,18.54 117.86,17.78 R1.2 | 118.62,22.86 118.49,22.99
A5N
  Top 0.254: U2.7 109.2,28.72 109.98,27.94 132.84,27.94 135.64,27.94 144.27,19.3 144.27,18.54 144.02,18.29 C7.2 143.76,18.29 142.75,17.27 R14.2
A5P
  Top 0.254: U2.8 109.78,29.72 132.08,29.72 135.38,29.72 145.8,19.3 C7.1 147.32,18.29 148.59,17.02 R13.2 | R13.2 148.59,15.75 R13.2
A6N
  Top 0.254: U2.10 153.14,31.77 159.49,31.77 171.45,19.81 171.45,18.8 171.7,18.54 C5.2 172.21,18.54 173.23,17.53 R10.2
A6P
  Top 0.254: U2.9 152.63,31.27 157.96,31.27 169.93,19.3 C5.1 169.42,18.54 168.66,17.78 R9.2
A7N
  Top 0.254: U2.11 177.79,32.27 182.61,32.27 194.82,20.07 195.83,19.05 C2.2 195.58,18.54 195.83,18.29 195.83,17.78 194.56,16.51 R4.2
A7P
  Top 0.254: U2.12 178.56,32.77 184.15,32.77 197.36,19.56 C2.1 197.87,18.54 199.39,17.02 R3.2
ADCCLK  (via drill 0.38)
  Top 0.305: U2.23 106.7,37.06 105.66,38.1 105.66,38.86 107.95,41.15 107.95,54.1 v109.47,55.63
  Bottom 0.305: v109.47,55.63 113.72,55.63 U$1.27
ADCRDY  (via drill 0.38)  (1 unrouted)
  Top 0.305: U2.18 109.2,37.32 109.73,37.85 111,37.85 v111.25,37.59 | v111.25,40.89 111.25,50.55 115.57,54.86
  Bottom 0.305: v111.25,37.59 v111.25,40.89
ADCSYNC  (via drill 0.38)
  Top 0.305: U2.16 111.17,35.99 v111.25,36.07 | v109.98,41.15 110.49,41.66 110.49,57.47 U$1.29
  Bottom 0.305: v111.25,36.07 110.24,37.08 110.24,40.89 v109.98,41.15
AGND  (via drill 0.38, 0.4)  (23 unrouted)
  Top 0.254: U2.28 103.38,33.27 v103.12,33.78 | U2.13 112.77,33.27 v113.28,33.78 | C29.2 v104.39,12.95 | C30.2 v107.44,12.7 | U3.11 108.22,17.03 v108.2,17.02 108.08,16.89 107.95,17.02 107.72,17.25 U3.10 | U3.1 105.18,22.07 v104.9,22.35 | U3.31 107.72,23.64 v108.2,24.13 108.72,23.62 U3.29 | U3.27 109.72,25.39 109.73,25.4 | 109.73,25.4 v109.47,25.65 109.73,25.4 | 109.73,25.4 C28.2 110.62,25.53 C31.2
  Top 0.28: U4.P$7 220.03,41.52 v219.68,41.11 | C13.2 | C13.2 v199.89,48.37 | U5.P$7 205.53,49.36 v205.51,48.84 | U4.P$10 221.98,41.57 v222.23,40.81 | U4.P$6 219.38,42.07 v218.43,41.11
  Top 0.305: C14.2 215.84,43.49 v215.9,43.43
  Top 0.61: C12.2 226.37,46.05 v227.08,46.06 | R17.1 210.54,47.82 v210.36,48.09 | C24.2 v221.22,38.11 v221.23,38.1 | D1.A 221.64,34.4 v221.74,34.29 | D2.C 206.3,34.49 v205.99,35.05 | C26.2 206.36,37.23 v206.25,37.34
  Bottom 0.254: v103.12,33.78 102.87,33.02 102.62,32.77 | v113.28,33.78 113.28,34.04 114.05,34.8 116.33,34.8 117.09,33.78 117.09,32 | v104.39,12.95 104.14,12.95 | v108.2,17.02 107.95,16.76 | v104.9,22.35 104.65,22.35 | v108.2,24.13 108.46,23.88 | v109.47,25.65 109.22,25.65
  Bottom 0.28: v219.68,41.11 219.78,41.21 | v205.51,48.84 205.31,48.14 205.01,48.44 | v222.23,40.81 221.88,41.56 | v218.43,41.11 218.78,40.66
  Bottom 0.305: v215.9,43.43 215.9,43.18
  Bottom 0.61: v227.08,46.06 226.63,46.01 | v210.36,48.09 210.06,48.44 209.61,48.34 | v221.23,38.1 221.23,37.85 | v221.74,34.29 221.49,34.29 | v205.99,35.05 205.49,34.54 | v206.25,37.34 205.99,37.08
  pour Bottom: 108.2,33.02 199.9,33.02 199.64,42.42 230.63,42.93 230.89,-6.86 2.03,-6.86 2.03,33.27
AIN0N
  Top 0.254: J1.2 20.55,11.66 21.08,12.19 R16.1
AIN0P
  Top 0.254: J1.1 17.55,13.36 R15.1
AIN1N
  Top 0.254: J2.2 45.95,11.2 44.2,12.95 43.31,12.95 R12.1
AIN1P
  Top 0.254: J2.1 44.13,10.99 45.47,9.65 46.23,9.65 47.24,10.41 47.24,13.34 R11.1
AIN2N
  Top 0.254: R8.1 72.64,12.28 J3.2
AIN2P
  Top 0.254: J3.1 68.35,11.91 67.06,13.21 R7.1
AIN3N
  Top 0.254: R6.1 93.85,14.35 94.74,13.46 94.74,12.95 96.52,11.18 96.56,11.18 J4.2
AIN3P
  Top 0.254: J4.1 94.93,10.99 96.27,9.65 97.03,9.65 98.3,10.67 98.3,12.83 R5.1
AIN4N
  Top 0.254: R2.1 123.19,12.03 J5.2
AIN4P  (1 unrouted)
  Top 0.254: R1.1 117.86,12.19 119.13,10.92
AIN5N
  Top 0.254: J6.1 145.73,10.99 147.07,9.65 147.83,9.65 149.1,10.41 149.1,13.59 R13.1
AIN5P
  Top 0.254: J6.2 147.51,10.99 145.29,13.21 143.64,13.21 R14.1
AIN6N
  Top 0.254: R10.1 173.23,11.27 J7.2
AIN6P  (1 unrouted)
  Top 0.254: R9.1 168.66,12.45 169.93,11.18 | J7.1 169.95,10.95 169.93,10.92
AIN7N
  Top 0.254: J8.2 198.35,11.2 196.34,13.21 196.34,13.72 196.09,13.97 194.69,13.97 R4.1
AIN7P
  Top 0.254: J8.1 196.53,10.99 197.87,9.65 198.63,9.65 199.9,10.67 199.9,13.59 R3.1
DACCS  (via drill 0.38)
  Top 0.254: U3.13 v109.22,15.5 v109.22,15.49
  Top 0.305: v102.36,35.56 102.36,37.83 U$1.20
  Bottom 0.254: v109.22,15.49 106.43,15.49 105.16,16.76 105.16,20.83 103.63,22.35 103.63,24.38 102.36,25.65 102.36,26.67
  Bottom 0.305: 102.36,26.67 v102.36,35.56
DACRST  (1 unrouted)
GND  (via drill 0.38, 0.4)
  Top 0.254: U2.25 104.72,35.74 v104.65,35.81
  Top 0.305: C17.2 104.9,39.88 v105.41,40.39
  Top 0.61: C10.2 196.11,56.23 v196.09,56.25 | C16.2 196.24,54.1 v196.19,54.05 | C18.1 192.63,54 v192.69,54.05 | C19.2 192.73,56.1 v192.79,56.15 | C20.1 v188.59,54.55 | C21.2 188.5,55.71 v188.49,55.7 | C11.2 200.12,54.38 v200.14,54.65 | C9.2 v201.67,56.9 v201.68,56.9
  Bottom 0.254: v104.65,35.81 104.39,35.56
  Bottom 0.305: v105.41,40.39 104.9,40.39 104.65,40.13
  Bottom 0.61: v196.09,56.25 196.09,56.35 | v196.19,54.05 196.19,54.55 | v192.69,54.05 192.89,54.25 | v192.79,56.15 192.79,56.45 | v188.59,54.55 188.59,54.85 188.89,55.15 | v188.49,55.7 188.99,55.85 189.39,56.25 | v201.68,56.9 201.93,56.64
  pour Bottom: -1.78,34.54 198.63,34.29 198.63,45.21 230.63,44.45 229.87,94.49 -1.78,94.49
K6N  (1 unrouted)
  Top 0.406: J7.8 172.47,8.89 173.48,9.91 174.5,10.67 174.5,13.21 175.51,14.73 D4.A | Q2.3 177.8,15.75 176.78,14.73
K6P  (via drill 0.38)
  Top 0.406: v178.05,12.7 179.07,13.72 179.07,14.48 178.82,14.73 D4.C R20.1 181.1,14.86 C27.2
  Bottom 0.406: J7.3 174.24,8.89 v178.05,12.7
K7N  (via drill 0.38)
  Top 0.406: v200.91,10.67 200.91,12.58 D3.A | D3.A 201.93,13.72 | Q1.3 203.12,17.78 203.12,14.14 202.69,13.72 D3.A
  Bottom 0.406: J8.8 197.87,8.89 198.88,9.91 199.9,10.67 v200.91,10.67
K7P
  Top 0.406: J8.3 200.91,8.89 201.17,9.14 201.17,9.4 201.93,10.16 201.93,10.41 204.22,12.7 204.22,13.58 D3.C 207.52,13.72 207.77,13.97 C25.2 208.15,13.34 R19.1
N$1
  Top 0.28: U5.P$3 208.36,45.19 210.12,43.43
  Top 0.61: C15.2 210.04,43.31 210.12,43.43 210.11,44.84 210.94,45.25 R17.2 211.82,43.65 211.79,42.97 R18.1
N$2
  Top 0.305: U2.24 106,36.24 C17.1
N$3  (1 unrouted)
  Top 0.406: Q2.1 176.77,17.29 176.02,18.03 176.02,21.84 176.53,22.35 176.78,22.35
N$4  (1 unrouted)
  Top 0.406: Q1.1 202.25,15.94 201.68,16.51 201.68,20.32
N$8
  Top 0.254: U3.26 110.22,23.6 C28.1
N$11
  Top 0.254: U3.25 110.86,22.72 111.76,23.62 112.65,23.62 C31.1
N$16
  Top 0.28: 220.68,42.96 220.68,40.71
N$17
  Top 0.28: 221.33,42.46 221.33,40.71
N$18  (via drill 0.4)
  Top 0.254: U5.P$14 201.81,44.54 v201.21,44.19 | v201.21,46.09 201.21,46.72 C13.1
  Bottom 0.254: v201.21,44.19 v201.21,46.09
N$23
  Top 0.28: 224.18,45.76 224.09,45.76 C12.1 223.9,45.67 U4.P$14
R6  (via drill 0.38)  (1 unrouted)
  Top 0.406: R21.2 178.44,31.11 v178.56,31.24 | v178.56,35.05 153.42,35.05 118.11,70.36 115.82,70.36 115.57,70.1
  Bottom 0.406: v178.56,31.24 v178.56,35.05
R7  (via drill 0.38)  (1 unrouted)
  Top 0.305: 195.33,23.11 196.47,23.11 R22.2
  Top 0.406: R22.2 199.77,20.19 | 195.33,23.11 v187.45,30.99 | v187.71,35.31 187.71,35.81 187.45,36.07
  Bottom 0.406: v187.45,30.99 187.45,35.05 v187.71,35.31
RGND  (via drill 0.38)  (1 unrouted)
  Top 0.305: 195.83,23.88 203.2,23.88 204.22,22.86 204.22,16.51 204.34,16.38
  Top 0.406: Q2.2 179.34,17.29 179.83,17.78 v179.83,31.24 | v179.83,35.31 179.83,36.32 | Q1.2 204.15,16.19 204.34,16.38 204.47,16.51 | 195.83,23.88 v188.98,30.73 | v189.23,35.05 188.98,35.31
  Bottom 0.406: v179.83,31.24 v179.83,35.31 | v188.98,30.73 188.98,34.8 v189.23,35.05
SPIOCLK  (via drill 0.38)
  Top 0.254: U2.19 108.7,37.58 109.73,38.61 114.55,38.61 | 114.55,38.61 117.6,41.66 117.6,47.99 U$1.24 | v115.32,34.04 115.32,37.85 114.55,38.61 | v113.03,15.49 111,15.49 109.73,16.76 109.73,17.91 U3.14
  Bottom 0.254: v115.32,34.04 115.32,33.27 114.81,32.77 114.81,32.26 114.81,29.21 114.81,19.81 114.81,18.29 114.81,17.78 v113.03,15.49
SPIORX  (via drill 0.38)
  Top 0.254: U2.20 108.2,38.1 109.47,39.37 112.71,39.37 113.5,40.17 | 113.5,40.17 U$1.21 | U3.15 110.22,17.04 111,16.26 112.52,16.26 v113.03,16.76 | v113.54,39.37 113.54,40.13 113.5,40.17
  Bottom 0.254: v113.03,16.76 113.03,17.02 114.3,18.29 114.3,28.19 113.79,28.7 113.79,29.21 112.78,30.23 112.27,30.73 112.27,38.1 v113.54,39.37
SPIOTX  (via drill 0.38)
  Top 0.254: U2.21 107.7,37.59 v106.68,38.61 107.44,38.61 108.97,40.13 112.27,40.13 113.28,41.15 113.28,50.11 U$1.25 | U3.16 110.72,17.3 111.25,16.76 112.27,16.76 112.52,17.02 v112.52,17.78
  Bottom 0.254: 111.51,29.97 111.38,30.1 | 111.38,30.1 106.68,34.8 v106.68,38.61 | v112.52,17.78 112.52,28.96 111.38,30.1
USB+
  Top 0.61: C23.1 166.18,56.33 PS1.14
USB-
  Top 0.61: C23.2 167.24,53.52 PS1.1
VIN+
  Top 0.28: U4.P$15 223.48,46.66 223.48,47.36 223.33,47.41 U4.P$16 223.48,47.41 224.48,47.41 | U4.P$13 224.03,45.02 224.23,45.01
  Top 0.305: 224.23,45.01 227.64,45.01 227.71,45.09
  Top 0.406: 224.48,47.41 227.16,47.41 228.09,46.48 228.09,45.47 227.71,45.09 227.58,44.96
  Top 0.61: L2.2 198.07,58.85 C10.1 200.15,59.03 | 200.15,59.03 C9.1 | 224.48,47.41 223.66,47.41 | 223.66,47.41 223.33,47.41 | 223.66,47.41 208.65,59.07 206.76,59.18 202.69,59.18 200.15,59.03
VIN-
  Top 0.305: U5.P$13 200.13,45.19 199.9,44.96 | U5.P$16 200.54,42.79 199.9,43.43 | U5.P$15 202.48,43.73 202.18,43.43 200.15,43.43 199.9,43.69
  Top 0.406: C11.1 200.15,52.1 200.15,52.07 199.38,51.3 C16.1 L1.2
  Top 0.61: 199.9,43.43 199.9,43.69 199.9,44.96 199.9,45.72 198.37,47.5 198.37,49.53 200.15,52.07
VS0  (via drill 0.38)
  Top 0.254: v23.11,13.72 v40.13,13.72 | v49.02,13.72 v63.75,13.72 | v74.68,13.72 88.9,13.72 v89.92,13.46 | v99.06,14.22 99.06,19.05 101.58,21.57 U3.2
  Bottom 0.254: J1.7 16.32,11.87 16.51,12.19 18.03,13.72 v23.11,13.72 | v40.13,13.72 v49.02,13.72 | v63.75,13.72 v74.68,13.72 | v89.92,13.46 v99.06,14.22
VS1  (via drill 0.38)
  Top 0.254: J2.7 41.73,11.36 v40.39,12.7 | v48.77,12.45 v64.01,12.45 | v74.42,12.45 v88.9,12.45 | v99.82,13.21 99.82,19.05 101.85,21.08 106.55,21.08 U3.3
  Bottom 0.254: v40.39,12.7 40.64,12.7 41.15,13.21 48.01,13.21 v48.77,12.45 | v64.01,12.45 v74.42,12.45 | v88.9,12.45 90.17,12.45 91.19,13.46 98.81,13.46 99.06,13.21 v99.82,13.21
VS2  (via drill 0.38)
  Top 0.254: J3.7 67.12,9.33 65.53,10.92 65.53,14.48 v65.02,14.99 | v74.93,14.99 v89.15,14.99 | v100.58,14.99 100.58,18.8 102.36,20.57 U3.4
  Bottom 0.254: v65.02,14.99 v74.93,14.99 | v89.15,14.99 v100.58,14.99
VS3  (via drill 0.38)
  Top 0.254: J4.7 92.53,11.36 v91.44,12.45 | U3.5 102.87,20.07 101.35,18.54 101.35,13.97 v100.84,13.46
  Bottom 0.254: v91.44,12.45 100.58,12.45 100.84,12.7 v100.84,13.46
VS4
  Top 0.254: U3.20 112.77,20.07 113.79,19.05 113.79,13.02 J5.7
VS5  (via drill 0.38)
  Top 0.254: 117.56,20.61 v117.6,20.57 U3.21 | v120.65,20.57 131.64,20.57 J6.7
  Bottom 0.254: v117.6,20.57 v120.65,20.57
VS6  (via drill 0.38)
  Top 0.254: J7.7 168.72,9.33 165.61,12.45 151.89,12.45 v151.38,11.94 | U3.22 116.57,21.07 v117.09,21.59 | v121.67,21.34 131.57,21.34 140.46,12.45 v140.97,12.45
  Bottom 0.254: v151.38,11.94 141.22,11.94 140.97,12.19 v140.97,12.45 | v117.09,21.59 119.63,21.59 119.89,21.34 v121.67,21.34
VS7  (via drill 0.38)  (1 unrouted)
  Top 0.254: J8.7 194.12,9.58 192.28,11.43 177.8,11.43 v175.77,13.21 | v166.88,13.21 v150.37,13.21 | U3.23 115.3,21.57 v116.33,22.35 | v120.65,22.1 131.83,22.1 v140.21,13.72
  Bottom 0.254: v175.77,13.21 v166.88,13.21 | v150.37,13.21 140.72,13.21 v140.21,13.72 | 136.91,13.21 136.65,13.46 | v116.33,22.35 120.4,22.1 v120.65,22.1